# Altium schematic sheet Connector-Section.SchDoc
size A4; SheetNumber: 8; SheetTotal: 8
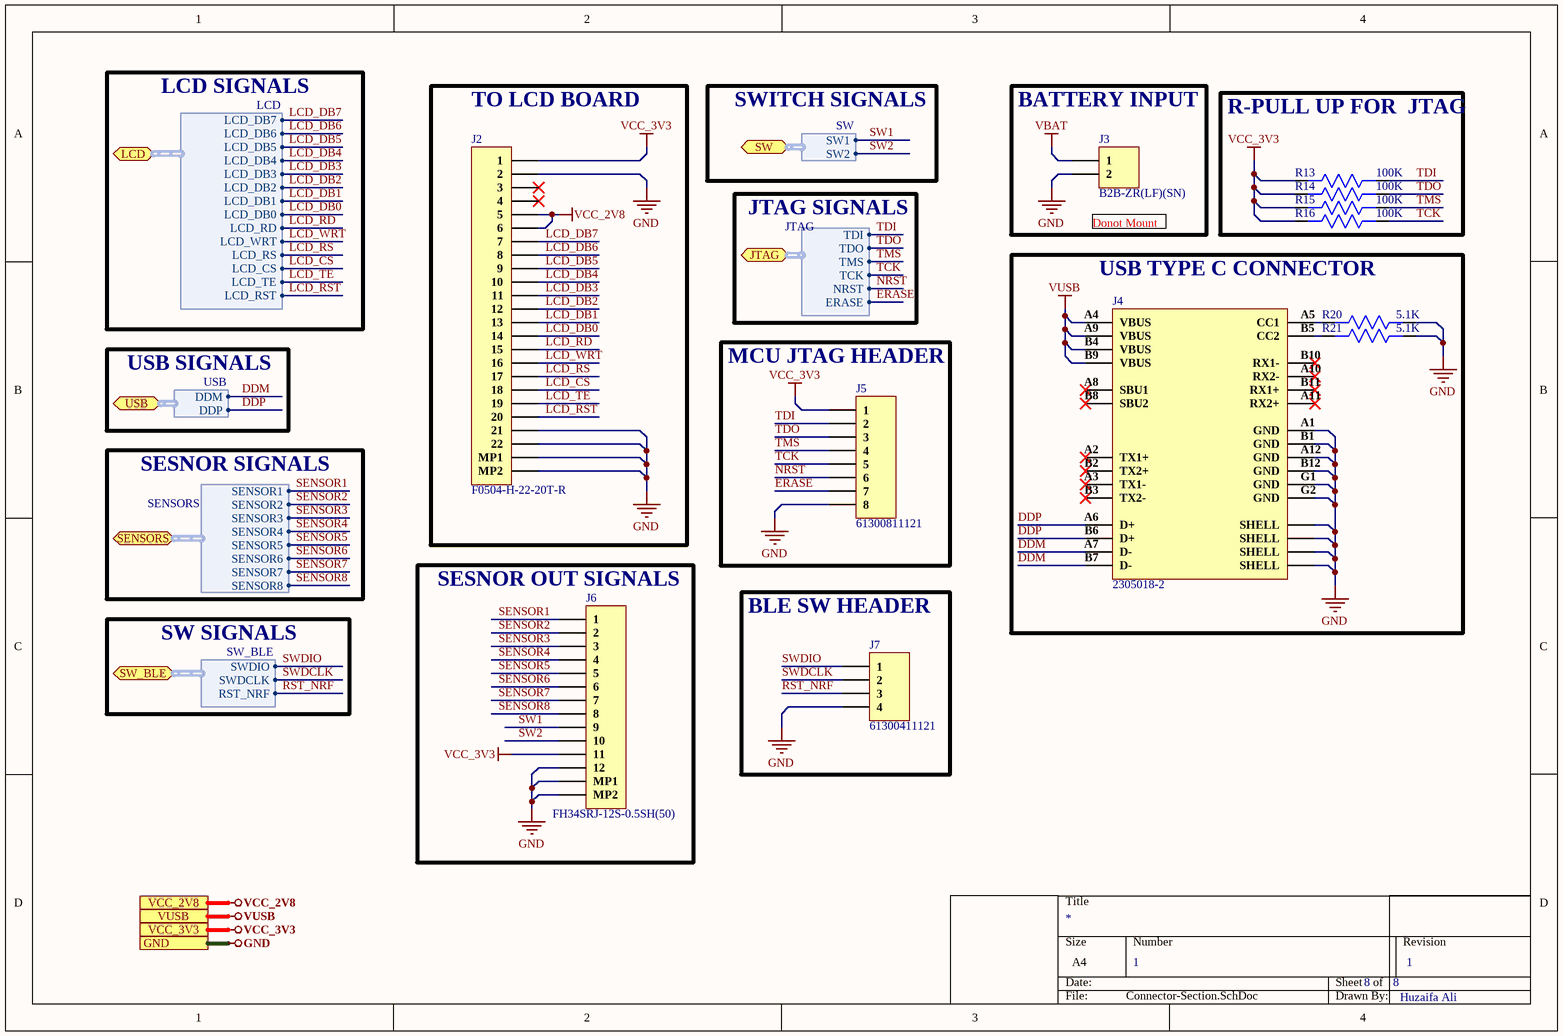
[diagram p0: Connector-Section.SchDoc]

## Parts
J2  F0504-H-22-20T-R  [F0504-H-22-20T-R]
J3  B2B-ZR(LF)(SN)  [B2B-ZR(LF)(SN)]
J4  2305018-2  [2305018-2]
J5  61300811121  [HDR1X8]
J6  FH34SRJ-12S-0.5SH(50)  [FH34SRJ-12S-0.5SH(50)]
J7  61300411121  [HDR1X4]
R13  100K  [Res0402]
R14  100K  [Res0402]
R15  100K  [Res0402]
R16  100K  [Res0402]
R20  5.1K  [Res0603]
R21  5.1K  [Res0603]

## Blocks framed on the sheet
TO LCD BOARD: J2
BATTERY INPUT: J3
R-PULL UP FOR  JTAG: R13-R16
USB TYPE C CONNECTOR: J4 R20 R21
MCU JTAG HEADER: J5
SESNOR OUT SIGNALS: J6
BLE SW HEADER: J7

## Ports
GND, JTAG (bidir, harness JTAG), LCD (bidir, harness LCD), SENSORS (bidir, harness SENSORS), SW (bidir, harness SW), SW_BLE (bidir, harness SW_BLE), USB (bidir, harness USB), VCC_2V8, VCC_3V3, VUSB

## Harnesses
USB: DDM, DDP
LCD: LCD_DB7, LCD_DB6, LCD_DB5, LCD_DB0, LCD_DB1, LCD_DB2, LCD_DB3, LCD_DB4, LCD_RD, LCD_WRT, LCD_RS, LCD_CS, LCD_TE, LCD_RST
SENSORS: SENSOR1, SENSOR2, SENSOR3, SENSOR4, SENSOR5, SENSOR6, SENSOR7, SENSOR8
SW: SW1, SW2
JTAG: TDI, TDO, TMS, TCK, NRST, ERASE
SW_BLE: SWDIO, SWDCLK, RST_NRF

## Nets
GND: J2.2 J2.21 J2.22 J2.MP1 J2.MP2 J3.2 J4.A1(GND) J4.A12(GND) J4.B1(GND) J4.B12(GND) J4.G1(GND) J4.G2(GND) J4.S1(SHELL) J4.S2(SHELL) J4.S3(SHELL) J4.S4(SHELL) J5.8 J6.12 J6.MP1 J6.MP2 J7.4 R20.1 R21.1 ; port GND
VBAT: J3.1
VCC_2V8: J2.5 J2.6 ; port VCC_2V8
VCC_3V3: J2.1 J5.1 J6.11 R13.2 R14.2 R15.2 R16.2 ; port VCC_3V3
VUSB: J4.A4(VBUS) J4.A9(VBUS) J4.B4(VBUS) J4.B9(VBUS) ; port VUSB
DDM: J4.A7(D-) J4.B7(D-) ; port USB.DDM
DDP: J4.A6(D+) J4.B6(D+) ; port USB.DDP
ERASE: J5.7 ; port JTAG.ERASE
LCD_CS: J2.18 ; port LCD.LCD_CS
LCD_DB0: J2.14 ; port LCD.LCD_DB0
LCD_DB1: J2.13 ; port LCD.LCD_DB1
LCD_DB2: J2.12 ; port LCD.LCD_DB2
LCD_DB3: J2.11 ; port LCD.LCD_DB3
LCD_DB4: J2.10 ; port LCD.LCD_DB4
LCD_DB5: J2.9 ; port LCD.LCD_DB5
LCD_DB6: J2.8 ; port LCD.LCD_DB6
LCD_DB7: J2.7 ; port LCD.LCD_DB7
LCD_RD: J2.15 ; port LCD.LCD_RD
LCD_RS: J2.17 ; port LCD.LCD_RS
LCD_RST: J2.20 ; port LCD.LCD_RST
LCD_TE: J2.19 ; port LCD.LCD_TE
LCD_WRT: J2.16 ; port LCD.LCD_WRT
NRST: J5.6 ; port JTAG.NRST
RST_NRF: J7.3 ; port SW_BLE.RST_NRF
SENSOR1: J6.1 ; port SENSORS.SENSOR1
SENSOR2: J6.2 ; port SENSORS.SENSOR2
SENSOR3: J6.3 ; port SENSORS.SENSOR3
SENSOR4: J6.4 ; port SENSORS.SENSOR4
SENSOR5: J6.5 ; port SENSORS.SENSOR5
SENSOR6: J6.6 ; port SENSORS.SENSOR6
SENSOR7: J6.7 ; port SENSORS.SENSOR7
SENSOR8: J6.8 ; port SENSORS.SENSOR8
SW1: J6.9 ; port SW.SW1
SW2: J6.10 ; port SW.SW2
SWDCLK: J7.2 ; port SW_BLE.SWDCLK
SWDIO: J7.1 ; port SW_BLE.SWDIO
TCK: J5.5 R16.1 ; port JTAG.TCK
TDI: J5.2 R13.1 ; port JTAG.TDI
TDO: J5.3 R14.1 ; port JTAG.TDO
TMS: J5.4 R15.1 ; port JTAG.TMS
NetJ4_A5: J4.A5(CC1) R20.2
NetJ4_B5: J4.B5(CC2) R21.2

Not connected (* = marked no-connect by the designer): J2 3* 4*; J4 A2(TX1+)* A3(TX1-)* A8(SBU1)* A10(RX2-)* A11(RX2+)* B2(TX2+)* B3(TX2-)* B8(SBU2)* B10(RX1-)* B11(RX1+)*

## Notes on the sheet
- LCD SIGNALS
- SWITCH SIGNALS
- JTAG SIGNALS
- (near J3) Donot Mount
- USB SIGNALS
- SESNOR SIGNALS
- SW SIGNALS
- 1
- Huzaifa Ali

## Library data of the parts
J2 = F0504-H-22-20T-R: Clamshell 22 Double-sided contacts/up and down connection Surface Mount 0.5mm SMD,P=0.5mm FFC/FPC Connectors ROHS; Manufacturer: XFCN; Manufacturer Part Number: F0504-H-22-20T-R; Footprint: Custom; ComponentLink1Description: LCSC; ComponentLink1URL: https://lcsc.com/product-detail/FFC-FPC-Connectors_XFCN-F0504-H-22-20T-R_C557729.html
J3 = B2B-ZR(LF)(SN): CONN HEADER VERT 2POS 1.5MM; Manufacturer: JST; Body Plating: Tin; Number of Positions: 2; Contact Resistance: 30mR; Max Current Rating: 1A; Max Voltage Rating (AC): 50V; Gender: Male; Insulation Resistance: 500MR; Panel Thickness: 3.5mm; Supplier 1: Digi-Key; Manufacturer Part Number: B2B-ZR(LF)(SN); RoHS: Yes; Category: Board to Board Connectors; Stock 1: 113095; Pricing 1: 1=0.17000, 10=0.13500, 100=0.09990, 500=0.08270, 1000=0.07237, 5000=0.06203, 10000=0.06031 (USD); Mount: Through Hole; Contact Plating: Copper,Tin; Color: White; Contact Material: Brass,Copper,Tin; Housing Color: Beige; Housing Material: Polyamide; Material: Nylon; Contact Shape: Circular; Insulation Material: Nylon; Insulation Color: Natural; Contact Finish - Mating: TIN; Min Operating Temperature: -25°C; Max Operating Temperature: 85°C; Number of Rows: 1; Packaging: Bulk; Connector Type: Header; Termination: Solder; Current Rating: 1A; Orientation: Straight; Fastening Type: Detent; Number of Contacts: 2; Series: ZH; Contact Type: Male Pin; Voltage Rating: 50V; Voltage Rating (AC): 50V; Voltage Rating (DC): 50V; Length: 4.5mm; Pitch: 1.5mm; Depth: 3.5mm; Lead Pitch: 1.5mm; Contact Mating Length: 0.094inch; Lead Free: Lead Free; REACH SVHC: No SVHC; Flammability Rating: UL94 V-0; ComponentLink1URL: https://datasheet.ciiva.com/11752/0900766b8082f580-11752167.pdf?src-supplier=RSComponents; ComponentLink1Description: https://datasheet.ciiva.com/11752/0900766b8082f580-11752167.pdf?src-supplier=RSComponents; ComponentLink2URL: https://datasheet.ciiva.com/25616/0900766b81147f94-25616906.pdf?src-supplier=RSComponents; ComponentLink2Description: https://datasheet.ciiva.com/25616/0900766b81147f94-25616906.pdf?src-supplier=RSComponents; ComponentLink3URL: https://datasheet.ciiva.com/26894/getdatasheetpartid-643133-26894438.pdf?src-supplier=Verical; ComponentLink3Description: https://datasheet.ciiva.com/26894/getdatasheetpartid-643133-26894438.pdf?src-supplier=Verical; ComponentLink4URL: https://datasheet.ciiva.com/712/ezh-712443.pdf?src-supplier=Digi-Key; ComponentLink4Description: https://datasheet.ciiva.com/712/ezh-712443.pdf?src-supplier=Digi-Key; ComponentLink5URL: https://datasheet.ciiva.com/8052/80551-8052026.pdf?src-supplier=Element14; ComponentLink5Description: https://datasheet.ciiva.com/8052/80551-8052026.pdf?src-supplier=Element14; Supplier Part Number 1: 455-1657-ND
J4 = 2305018-2: CONN RCP USB3.1 TYPEC 24P SMD RA; Manufacturer: TE Connectivity AMP; Connector Type: USB; Number of Contacts: 24; Gender: Receptacle; Number of Ports: 1; Current Rating: 1.25A; Voltage Rating: 30V; Shielding: Shielded; Ratings: Waterproof; Supplier 1: Digi-Key; Manufacturer Part Number: 2305018-2; RoHS: Yes; Category: USB Connectors; Stock 1: 4590; Pricing 1: 1=3.00000, 10=2.87800, 25=2.63840, 50=2.51840, 100=2.39840, 250=2.09864 (USD); Mount: Surface Mount,Through Hole; Contact Plating: Gold; Insulation Color: Black; Min Operating Temperature: -40°C; Max Operating Temperature: 85°C; Packaging: Tape and Reel; Termination: Solder; Flammability Rating: UL94 V-0; RoHS Compliant: Yes; ComponentLink1URL: http://www.farnell.com/datasheets/2611889.pdf?src-supplier=Farnell; ComponentLink1Description: http://www.farnell.com/datasheets/2611889.pdf?src-supplier=Farnell; ComponentLink2URL: https://www.te.com/commerce/DocumentDelivery/DDEController?Action=srchrtrv&DocNm=2305018&DocType=Customer+Drawing&DocLang=English&src-supplier=Digi-Key; ComponentLink2Description: https://www.te.com/commerce/DocumentDelivery/DDEController?Action=srchrtrv&DocNm=2305018&DocType=Customer+Drawing&DocLang=English&src-supplier=Digi-Key; ComponentLink3URL: http://www.farnell.com/datasheets/2611889.pdf?src-supplier=Newark; ComponentLink3Description: http://www.farnell.com/datasheets/2611889.pdf?src-supplier=Newark; Supplier Part Number 1: A132569CT-ND
J5 = 61300811121: CONN HEADER VERT 8POS 2.54MM; Manufacturer: Wurth Electronics; Number of Positions: 8; Gender: Male; Connector Type: Male Pin; Pitch: 0.1inch; Supplier 1: Digi-Key; Manufacturer Part Number: 61300811121; Stock 1: 7405; Pricing 1: 1=0.37, 10=0.315, 25=0.2632, 50=0.219, 100=0.199, 1000=0.181 (USD); Mount: Through Hole; Contact Plating: Gold; Contact Material: Copper; Color: Black; Number of Rows: 1; Packaging: Bulk; Termination: Solder; Number of Contacts: 8; Contact Mating Length: 0.236inch; REACH SVHC: Unknown; ComponentLink1URL: http://www.farnell.com/cad/1737268.pdf?src-supplier=Element14; ComponentLink1Description: http://www.farnell.com/cad/1737268.pdf?src-supplier=Element14; ComponentLink2URL: https://katalog.we-online.de/em/datasheet/6130xx11121.pdf?src-supplier=Digi-Key; ComponentLink2Description: https://katalog.we-online.de/em/datasheet/6130xx11121.pdf?src-supplier=Digi-Key; Supplier Part Number 1: 732-5321-ND
J6 = FH34SRJ-12S-0.5SH(50): CONN FPC/FFC 12POS .5MM; Manufacturer: Hirose; Supplier 1: Digi-Key; Manufacturer Part Number: FH34SRJ-12S-0.5SH(50); RoHS: Yes; Category: FFC / FPC; Pricing 1: 5000=0.47775 (USD); ComponentLink1URL: https://www.hirose.com/product/en/download_file/key_name/FH34SRJ/category/Catalog/doc_file_id/31646/?file_category_id=4&item_id=27&is_series=1&src-supplier=Digi-Key; ComponentLink1Description: https://www.hirose.com/product/en/download_file/key_name/FH34SRJ/category/Catalog/doc_file_id/31646/?file_category_id=4&item_id=27&is_series=1&src-supplier=Digi-Key; Supplier Part Number 1: FH34SRJ-12S-0.5SH(50)-ND
J7 = 61300411121: CONN HEADER VERT 4POS 2.54MM; Manufacturer: Wurth Electronics; Number of Positions: 4; Gender: Male; Connector Type: Male Pin; Pitch: 0.1inch; Supplier 1: Digi-Key; Manufacturer Part Number: 61300411121; Stock 1: 20544; Pricing 1: 1=0.18, 10=0.153, 25=0.1272, 50=0.106, 100=0.096, 1000=0.088 (USD); Mount: Through Hole; Contact Plating: Gold; Contact Material: Copper; Color: Black; Number of Rows: 1; Packaging: Bulk; Termination: Solder; Number of Contacts: 4; Contact Mating Length: 0.236inch; REACH SVHC: Unknown; Lead Free: Lead Free; ComponentLink1URL: http://www.farnell.com/cad/1737268.pdf?src-supplier=Element14; ComponentLink1Description: http://www.farnell.com/cad/1737268.pdf?src-supplier=Element14; ComponentLink2URL: https://katalog.we-online.de/em/datasheet/6130xx11121.pdf?src-supplier=Digi-Key; ComponentLink2Description: https://katalog.we-online.de/em/datasheet/6130xx11121.pdf?src-supplier=Digi-Key; Supplier Part Number 1: 732-5317-ND
R13-R16 = ERJPA2F1003X: RES SMD 100K OHM 1% 1/5W 0402; Manufacturer: Panasonic; Manufacturer Part Number: ERJ-PA2F1003X; Resistance: 100kR; Power Rating: 200mW; Voltage Rating: 50V; Temperature Coefficient: 100ppm/°C; Supplier 1: Digi-Key; Stock 1: 8829; Pricing 1: 1=0.21, 10=0.175, 100=0.0686, 1000=0.02871, 2500=0.02632, 5000=0.02393 (USD); Case/Package: 0402; Case Code (Metric): 1005; Case Code (Imperial): 0402; Min Operating Temperature: -55°C; Max Operating Temperature: 155°C; Packaging: Cut Tape; Composition: Thick Film; Number of Terminations: 2; Tolerance: 1%; Max Power Dissipation: 200mW; Voltage Rating (DC): 50V; Features: Automotive AEC-Q200; Length: 0.039inch; Height: 0.016inch; Width: 0.02inch; REACH SVHC: Unknown; ComponentLink1URL: http://www.farnell.com/datasheets/2051174.pdf?src-supplier=Element14; ComponentLink1Description: http://www.farnell.com/datasheets/2051174.pdf?src-supplier=Element14; ComponentLink2URL: https://industrial.panasonic.com/ww/system/files/data/download/catalog/id_fixed-resistors_e_1.pdf?src-supplier=Digi-Key; ComponentLink2Description: https://industrial.panasonic.com/ww/system/files/data/download/catalog/id_fixed-resistors_e_1.pdf?src-supplier=Digi-Key; Supplier Part Number 1: P17236CT-ND
R20 R21 = RMCF0603FT5K10: RES 5.1K OHM 1% 1/10W 0603; Manufacturer: Stackpole Electronics; Resistance: 5.1kR; Max Power Dissipation: 100mW; Temperature Coefficient: 100ppm/°C; Supplier 1: Digi-Key; Manufacturer Part Number: RMCF0603FT5K10; Stock 1: 58341; Pricing 1: 1=0.1, 10=0.017, 100=0.0068, 1000=0.00305, 2500=0.00264 (USD); Mount: Surface Mount; Case/Package: 0603; Case Code (Metric): 1608; Case Code (Imperial): 0603; Contact Plating: Tin,Matte; Min Operating Temperature: -55°C; Max Operating Temperature: 155°C; Tolerance: 1%; Packaging: Tape and Reel; Resistor Type: Thick Film; Number of Terminations: 2; Features: Automotive AEC-Q200; Series: RMCF; Length: 0.061inch; Width: 0.031inch; Height: 0.022inch; Radiation Hardening: No; RoHS Compliant: Yes; ComponentLink1URL: https://www.seielect.com/catalog/SEI-RMCF_RMCP.pdf?src-supplier=Avnet; ComponentLink1Description: https://www.seielect.com/catalog/SEI-RMCF_RMCP.pdf?src-supplier=Avnet; ComponentLink2URL: http://components.arrow.com/part/dataview/50863347S9465827N1174?src-supplier=Arrow+Electronics; ComponentLink2Description: http://components.arrow.com/part/dataview/50863347S9465827N1174?src-supplier=Arrow+Electronics; ComponentLink3URL: https://www.seielect.com/catalog/SEI-Packaging.pdf?src-supplier=Digi-Key; ComponentLink3Description: https://www.seielect.com/catalog/SEI-Packaging.pdf?src-supplier=Digi-Key; Supplier Part Number 1: RMCF0603FT5K10DKR-ND